# Altium schematic sheet 2.mcu.SchDoc
size A4; Organization: ORGANIZATION; Address1: ADDRESS 1; Address2: ADDRESS 2; Address3: ADDRESS 3; Address4: ADDRESS 4; DocumentNumber: 3; SheetNumber: 3; SheetTotal: 7; ENG_APP_DATE: --/--/--; DSN_APP_DATE: --/--/--; CHK_APP_DATE: --/--/--; Page: MCU; SPICEModelCacheMCBEDDJI: <root> / <DocumentId>MCBEDDJI</DocumentId> / <CacheFrame Number="0"> / <Model Name="xtal" Kind="CKT"> / <Text>*Generic type:crystal pkg:HC33/51 / .SUBCKT XTAL 1 2 PARAMS: FREQ=1Meg RS=750 C=13pf Q=1000 / LX 1 3 {((Q*RS)/(6.2831852*FREQ))} IC=0.5M / CX 3 4 {(1/(Q*6.2831852*FREQ*RS))} / C0 1 2 {C} / RS 4 2 {RS} / .ENDS XTAL</Text> / </Model> / </CacheFrame> / </root>
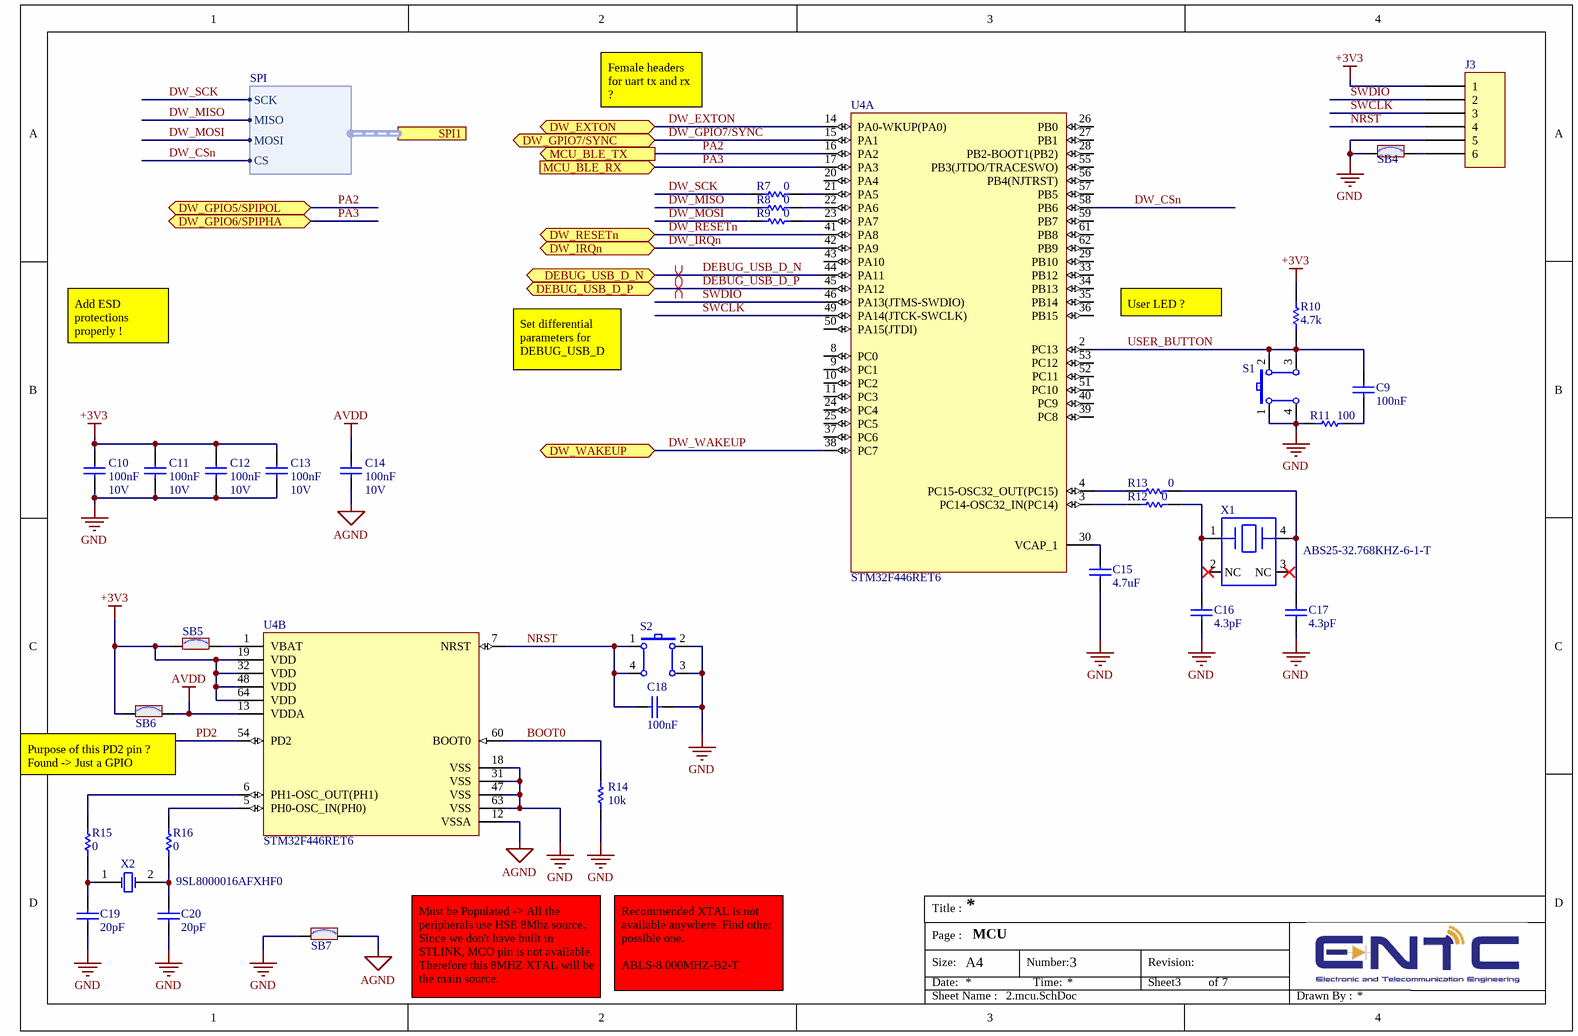
[diagram p0: 2.mcu.SchDoc]

## Parts
C9  100nF  [cap0603]
C10  100nF  Voltage Rating: 10V  [cap0603]
C11  100nF  Voltage Rating: 10V  [cap0603]
C12  100nF  Voltage Rating: 10V  [cap0603]
C13  100nF  Voltage Rating: 10V  [cap0603]
C14  100nF  Voltage Rating: 10V  [cap0603]
C15  4.7uF  [cap0603]
C16  4.3pF  [cap0603]
C17  4.3pF  [cap0603]
C18  100nF  [cap0603]
C19  20pF  [cap0603]
C20  20pF  [cap0603]
J3  (no value)  [HEADER_FEMALE_6POS_P2.54MM]
R7  0  [RES0402]
R8  0  [RES0402]
R9  0  [RES0402]
R10  4.7k  [RES0402]
R11  100  [RES0402]
R12  0  [RES0402]
R13  0  [RES0402]
R14  10k  [RES0402]
R15  0  [RES0402]
R16  0  [RES0402]
S1  (no value)
S2  (no value)
SB4  SB_ON  [SOLDER-BRIDGE_R0603-0R]  (value not drawn)
SB5  SB_ON  [SOLDER-BRIDGE_R0603-0R]  (value not drawn)
SB6  SB_ON  [SOLDER-BRIDGE_R0603-0R]  (value not drawn)
SB7  SB_ON  [SOLDER-BRIDGE_R0603-0R]  (value not drawn)
U4  STM32F446RET6  (parts A,B of 2)
X1  ABS25-32.768KHZ-6-1-T  [FP-ABS25-MFG]
X2  9SL8000016AFXHF0  [R38]

## Ports
DEBUG_USB_D_N (bidir), DEBUG_USB_D_P (bidir), DW_EXTON (bidir), DW_GPIO5/SPIPOL (bidir), DW_GPIO6/SPIPHA (bidir), DW_GPIO7/SYNC (bidir), DW_IRQn (bidir), DW_RESETn (bidir), DW_WAKEUP (bidir), MCU_BLE_RX (in), MCU_BLE_TX (out), SPI1 (harness SPI)

## Harnesses
SPI: SCK, MISO, MOSI, CS

## Nets
+3V3: C10.2 C11.2 C12.2 C13.2 J3.1 R10.2 SB5.1 SB6.1 U4.19(VDD) U4.32(VDD) U4.48(VDD) U4.64(VDD)
AGND: C14.1 SB7.2 U4.12(VSSA)
AVDD: C14.2 SB6.2 U4.13(VDDA)
GND: C10.1 C11.1 C12.1 C13.1 C15.1 C16.1 C17.1 C18.1 C19.1 C20.1 J3.5 R11.2 R14.1 S1.1 S1.4 S2.2 S2.3 SB4.1 SB7.1 U4.18(VSS) U4.31(VSS) U4.47(VSS) U4.63(VSS)
BOOT0: R14.2 U4.60(BOOT0)
DEBUG_USB_D_N: U4.44(PA11) ; port DEBUG_USB_D_N
DEBUG_USB_D_P: U4.45(PA12) ; port DEBUG_USB_D_P
DW_CSn: U4.58(PB6) ; port SPI1.CS
DW_EXTON: U4.14(PA0-WKUP(PA0)) ; port DW_EXTON
DW_GPIO7/SYNC: U4.15(PA1) ; port DW_GPIO7/SYNC
DW_IRQn: U4.42(PA9) ; port DW_IRQn
DW_MISO: R8.2 ; port SPI1.MISO
DW_MOSI: R9.2 ; port SPI1.MOSI
DW_RESETn: U4.41(PA8) ; port DW_RESETn
DW_SCK: R7.2 ; port SPI1.SCK
DW_WAKEUP: U4.38(PC7) ; port DW_WAKEUP
NRST: C18.2 J3.4 S2.1 S2.4 U4.7(NRST)
PA2: U4.16(PA2) ; port MCU_BLE_TX, port DW_GPIO5/SPIPOL
PA3: U4.17(PA3) ; port MCU_BLE_RX, port DW_GPIO6/SPIPHA
PD2: U4.54(PD2)
SWCLK: J3.3 U4.49(PA14(JTCK-SWCLK))
SWDIO: J3.2 U4.46(PA13(JTMS-SWDIO))
USER_BUTTON: C9.1 R10.1 S1.2 S1.3 U4.2(PC13)
NetC9_2: C9.2 R11.1
NetC15_2: C15.2 U4.30(VCAP_1)
NetC16_2: C16.2 R12.1 X1.1
NetC17_2: C17.2 R13.2 X1.4
NetC19_2: C19.2 R15.2 X2.1(OSC1)
NetC20_2: C20.2 R16.2 X2.2(OSC2)
NetJ3_6: J3.6 SB4.2
NetR7_1: R7.1 U4.21(PA5)
NetR8_1: R8.1 U4.22(PA6)
NetR9_1: R9.1 U4.23(PA7)
NetR12_2: R12.2 U4.3(PC14-OSC32_IN(PC14))
NetR13_1: R13.1 U4.4(PC15-OSC32_OUT(PC15))
NetR15_1: R15.1 U4.6(PH1-OSC_OUT(PH1))
NetR16_1: R16.1 U4.5(PH0-OSC_IN(PH0))
NetSB5_2: SB5.2 U4.1(VBAT)

Not connected (* = marked no-connect by the designer): U4 8(PC0) 9(PC1) 10(PC2) 11(PC3) 20(PA4) 24(PC4) 25(PC5) 26(PB0) 27(PB1) 28(PB2-BOOT1(PB2)) 29(PB10) 33(PB12) 34(PB13) 35(PB14) 36(PB15) 37(PC6) 39(PC8) 40(PC9) 43(PA10) 50(PA15(JTDI)) 51(PC10) 52(PC11) 53(PC12) 55(PB3(JTDO/TRACESWO)) 56(PB4(NJTRST)) 57(PB5) 59(PB7) 61(PB8) 62(PB9); X1 2(NC)* 3(NC)*

## Layout directives
differential pair: DEBUG_USB_D_N, DEBUG_USB_D_P

## Notes on the sheet
- Female headers for uart tx and rx ?
- User LED ?
- Add ESD protections properly !
- Set differential parameters for DEBUG_USB_D
- (near SB6) Purpose of this PD2 pin ? Found -> Just a GPIO
- Recommended XTAL is not available anywhere. Find other possible one.
  ABLS-8.000MHZ-B2-T
- Must be Populated -> All the peripherals use HSE 8Mhz source. Since we don't have built in STLINK, MCO pin is not available. Therefore this 8MHZ XTAL will be the main source.
- Title :
- Size:
- Date:
- Page :
- A4
- Number:
- Time:
- Revision:
- Sheet
- of
- Sheet Name :
- Drawn By :

## Library data of the parts
C9-C20 = Cap: Capacitor; MF: *; MP: *; JLCPCB: *
J3 = 6 Pin: CONN RCPT 6POS 0.1 GOLD PCB; Part Number: M20-7820642; Manufacturer: Harwin Inc.; Connector Type: Receptacle; Contact Length - Post: 0.118" (3.00mm); Current Rating (Amps): 3A; Mated Stacking Heights: 11.04mm, 12.63mm; Material Flammability Rating: UL94 V-0; Number of Positions: 6; Number of Positions Loaded: All; Pitch - Mating: 0.100" (2.54mm); Style: Board to Board or Cable; ComponentLink1Description: Datasheet; ComponentLink1URL: https://cdn.harwin.com/pdfs/C001XX_M20_Series_Connectors.pdf; ComponentLink2Description: DigiKey Link; ComponentLink2URL: https://www.digikey.com/en/products/detail/harwin-inc/M20-7820642/3727776; Contact Finish - Mating: Gold; Contact Finish - Post: Tin; Contact Finish Thickness - Mating: Flash; Contact Type: Female Socket; Fastening Type: Push-Pull; Insulation Color: Black; Insulation Height: 0.335" (8.51mm); LastUpdated: 9/21/2022 6:58:09 PM; Lifecycle Status: Active; Minimum Order: 1; Mounting Type: Through Hole; Number of Rows: 1; Operating Temperature: -40°C ~ 105°C; Packaging: Tube; Part Status: Active; Price: 0.55; Series: M20; Supplier 1: DigiKey; Supplier Part Number 1: 952-1808-ND; Termination: Solder
R7-R16 = Res: Resistor; Manufacturer: *; Manufacturer part number: *; JLCPCB part number: *
S1 S2 = SPST-NO 4 PIN: Switch Push button
SB4-SB7 = SB_ON: Solder Bridge ON; Internal_Part_Number: MCD-00071; Part_Type: Mechanical; Provided_By: Subcon; Initial_Board_Reference: mb1274; MP: PMR03EZPJ000; ECCN_US: n/a; ECCN_EU: n/a; Status: Released; JLCPCB: C253507
U4 = MC-ARM-STM32F446-LQFP64: ARM Cortex-M4 32-bit MCU+FPU, 512 KB Flash, 128 KB Internal RAM, 50 I/Os, 64-Pin LQFP, -40 to 85 degC, Tray; I/Os (High Current): 50; Supply Voltage(Vcc) min (V): 1.7; Operating Frequency(F) (Processor speed) (MHz): 180; D/A Converter: 2; Internal RAM Size (kB): 128; FLASH Size (Prog) (kB): 512; Core: ARM Cortex-M4; ComponentLink1Description: Manufacturer URL; Package Reference: 64-Pin Low-profile Quad Flat Package, Body 10 x 10 mm, Pitch 0.5 mm; ComponentLink2URL: http://www.st.com/st-web-ui/static/active/en/resource/technical/document/datasheet/DM00141306.pdf; Packing: Tray; DatasheetVersion: Rev. 6; ComponentLink1URL: http://www.st.com/; ComponentLink2Description: Datasheet; Package Description: LQFP64; Mounting Technology: Surface Mount
X1 = 28be33c29b20f54059194caee89ade4: CRYSTAL 32.7680KHZ 6PF SMD; ESR (Equivalent Series Resistance): 50kR; Frequency Tolerance: 10ppm; Series Resistance: 50kR; Frequency: 32.768kHz; Length: 8mm; Load Capacitance: 6pF; Packaging: Tape and Reel; Radiation Hardening: No; Min Operating Temperature: -40°C; Lead Free: Lead Free; Height: 0.098inch; Termination: SMD/SMT; Case/Package: SMD/SMT; Max Operating Temperature: 85°C; Mount: Surface Mount; Depth: 3.8mm; RoHS Compliant: Yes; Series: ABS25; Package Quantity: 3000; Operating Frequency: 32.768 kHz; Number of Pins: 4; Tolerance: 10ppm; Width: 0.15inch; REACH SVHC: No SVHC
X2 = XTAL: 8MHz(16pF) DIP package; Published: 8-Jun-2000; LatestRevisionDate: 17-Jul-2002; LatestRevisionNote: Re-released for DXP Platform.; PackageReference: R38; Publisher: Altium Limited; PackageDescription: Crystal, Thru-Hole; 2 Leads; Body 3.1 x 8.2 mm (Dia.xH)